# Altium schematic sheet Block diagram.SchDoc
size Letter; SheetNumber: 2; SheetTotal: 7
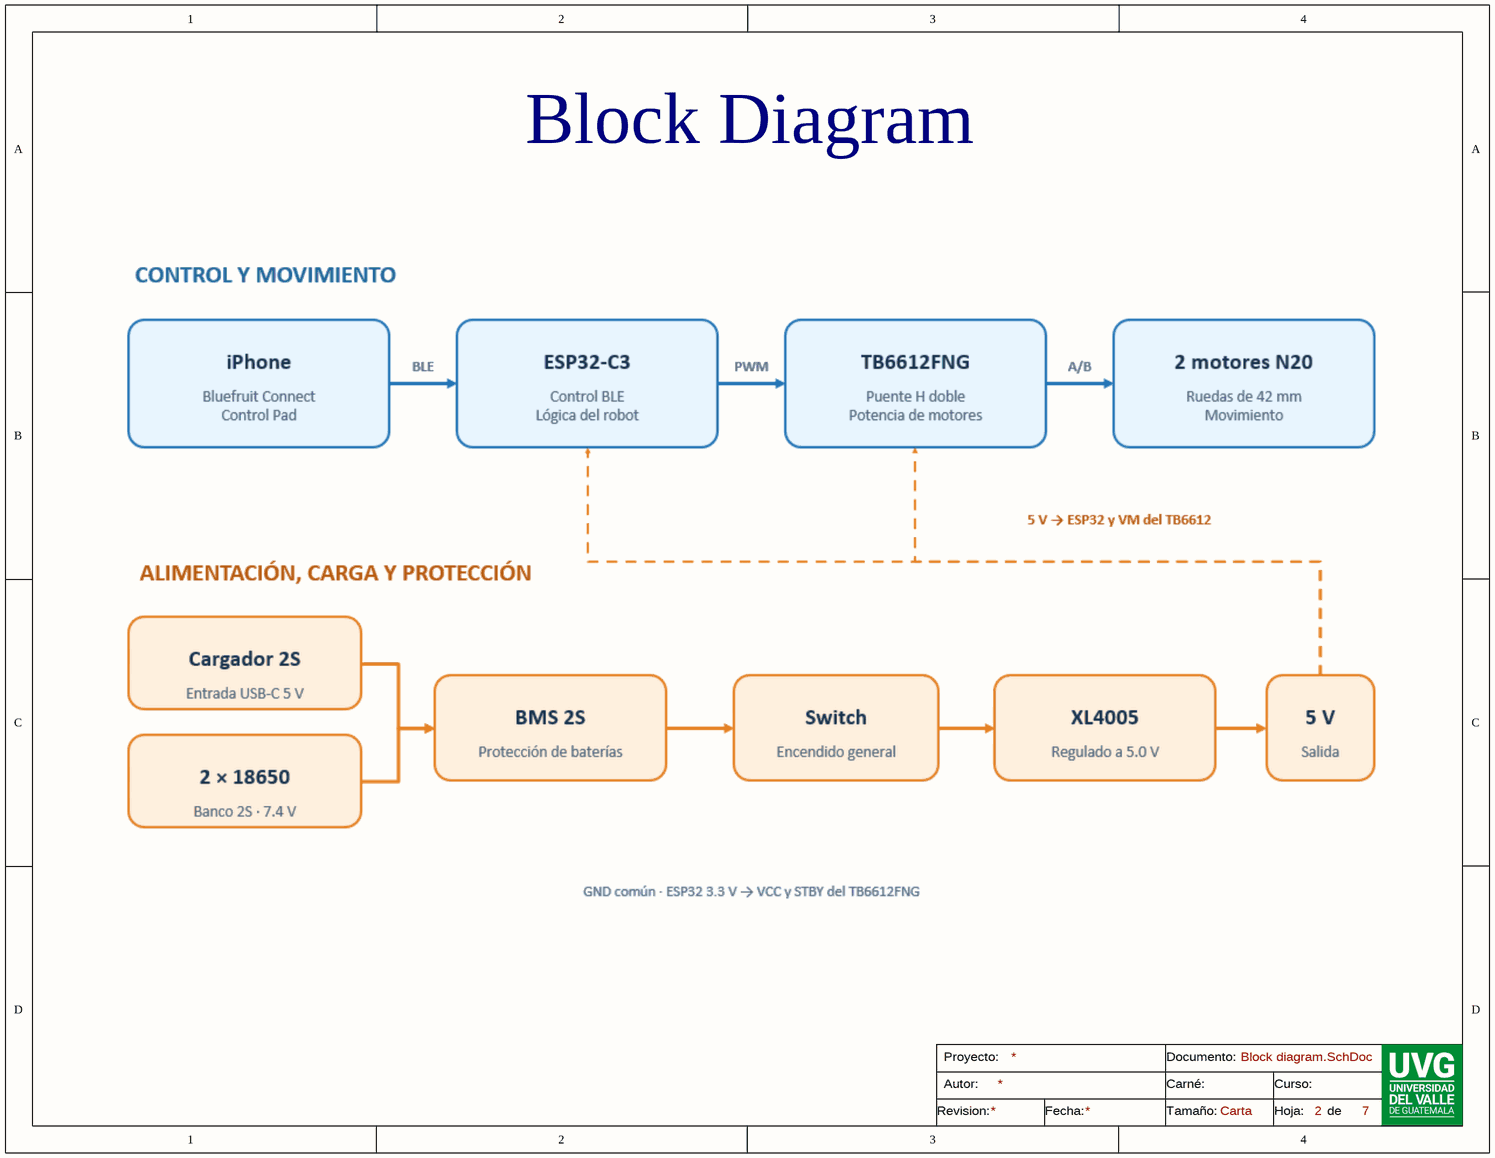
[diagram p0: Block diagram.SchDoc]

## Notes on the sheet
- Block Diagram
- Proyecto:
- Autor:
- Carné:
- Documento:
- Curso:
- Revision:
- Fecha:
- Tamaño:
- Carta
- Hoja:      de